# Altium project BLDC-Board-v1.0.PrjPcb (part 6 of 6)
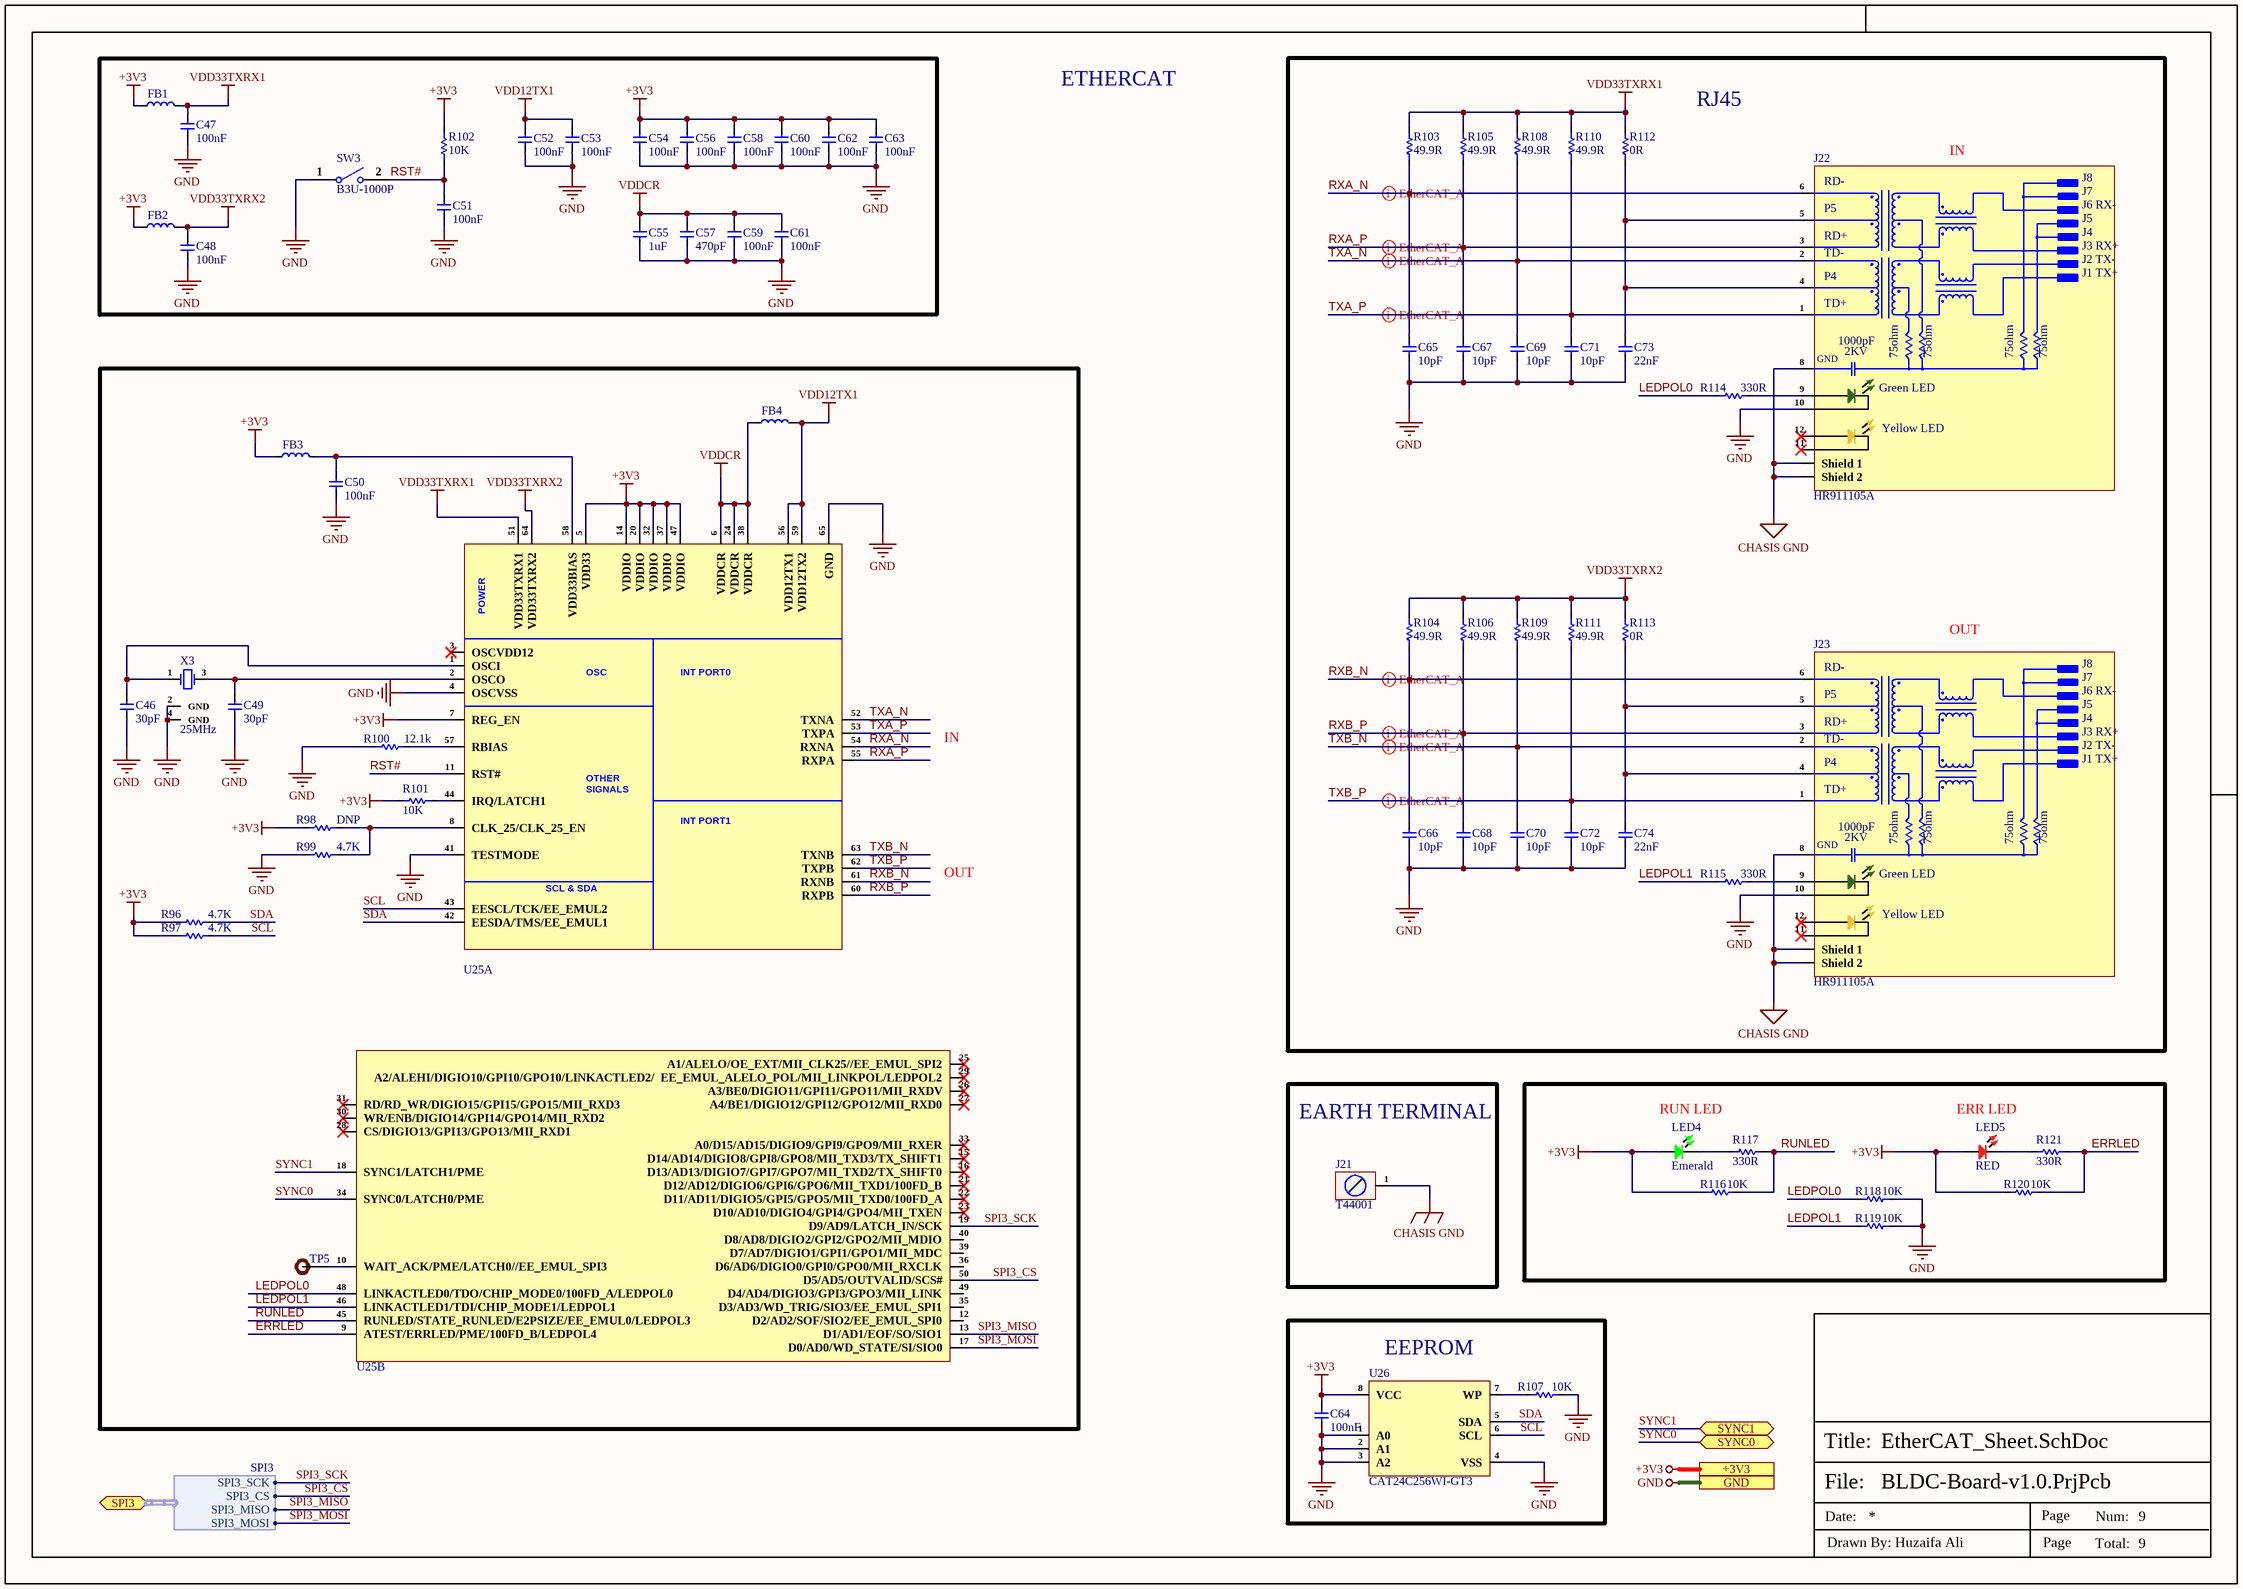
[diagram p9: EtherCAT_Sheet.SchDoc]

## Nets that join several sheets
+3V3: CAN_Sheet (C23.2 C25.2 U5.5 U6.5), Connector_Sheet1 (R78.2 R79.2), Connector_Sheet2 (R88.2 R89.2), Controller_Sheet (18 pins), Motor_Driver_Sheet (8 pins), Power_Sheet (C21.2 R28.1 TP3.1 U4.3), RS485_RS232_Sheet (9 pins), EtherCAT_Sheet (27 pins)
+5V: CAN_Sheet (10 pins), Connector_Sheet1 (8 pins), Connector_Sheet2 (8 pins), Power_Sheet (9 pins)
+24V: Motor_Driver_Sheet (12 pins), Power_Sheet (11 pins)
GND: CAN_Sheet (20 pins), Connector_Sheet1 (14 pins), Connector_Sheet2 (12 pins), Controller_Sheet (43 pins), Motor_Driver_Sheet (24 pins), Power_Sheet (18 pins), RS485_RS232_Sheet (11 pins), EtherCAT_Sheet (46 pins)
ADC_CURRENT1: Controller_Sheet (U1.21), Motor_Driver_Sheet (D21.1 R68.2 U9.4)
ADC_CURRENT2: Controller_Sheet (U1.22), Motor_Driver_Sheet (D22.1 R69.2 U10.4)
ADC_CURRENT3: Controller_Sheet (U1.23), Motor_Driver_Sheet (D23.1 R70.2 U11.4)
ADC_CURRENT4: Controller_Sheet (U1.24), Motor_Driver_Sheet (D24.1 R71.2 U12.4)
CAN1_RX: CAN_Sheet (R33.2), Controller_Sheet (U1.50)
CAN1_TX: CAN_Sheet (R34.2), Controller_Sheet (U1.51)
CAN2_RX: CAN_Sheet (R35.2), Controller_Sheet (U1.15)
CAN2_TX: CAN_Sheet (R36.2), Controller_Sheet (U1.16)
DIR1_IN: Connector_Sheet1 (R76.1), Controller_Sheet (U1.61)
DIR2_IN: Connector_Sheet1 (R77.1), Controller_Sheet (U1.58)
DIR3_IN: Connector_Sheet2 (R86.1), Controller_Sheet (U1.55)
DIR4_IN: Connector_Sheet2 (R87.1), Controller_Sheet (U1.52)
EN_CAN: CAN_Sheet (U5.6), Controller_Sheet (U1.29)
EN_CAN_2: CAN_Sheet (U6.6), Controller_Sheet (U1.37)
FB_1: Connector_Sheet1 (R78.1 U15.4), Controller_Sheet (U1.63)
FB_2: Connector_Sheet1 (R79.1 U16.4), Controller_Sheet (U1.60)
FB_3: Connector_Sheet2 (R88.1 U21.4), Controller_Sheet (U1.57)
FB_4: Connector_Sheet2 (R89.1 U22.4), Controller_Sheet (U1.54)
INH_MASK: CAN_Sheet (U5.11), Controller_Sheet (U1.32)
INH_MASK_2: CAN_Sheet (U6.11), Controller_Sheet (U1.17)
M1_PWR: Controller_Sheet (U2.16), Motor_Driver_Sheet (R72.2)
M2_PWR: Controller_Sheet (U2.17), Motor_Driver_Sheet (R73.2)
M3_PWR: Controller_Sheet (U2.19), Motor_Driver_Sheet (R74.2)
M4_PWR: Controller_Sheet (U2.20), Motor_Driver_Sheet (R75.2)
MOTOR1_GND: Connector_Sheet1 (C40.2 J17.2), Motor_Driver_Sheet (R60.2 U9.1)
MOTOR1_PLUS: Connector_Sheet1 (C40.1 J17.1), Motor_Driver_Sheet (K1.4)
MOTOR2_GND: Connector_Sheet1 (C41.2 J18.2), Motor_Driver_Sheet (R61.2 U10.1)
MOTOR2_PLUS: Connector_Sheet1 (C41.1 J18.1), Motor_Driver_Sheet (K2.4)
MOTOR3_GND: Connector_Sheet2 (C44.2 J19.2), Motor_Driver_Sheet (R62.2 U11.1)
MOTOR3_PLUS: Connector_Sheet2 (C44.1 J19.1), Motor_Driver_Sheet (K3.4)
MOTOR4_GND: Connector_Sheet2 (C45.2 J20.2), Motor_Driver_Sheet (R63.2 U12.1)
MOTOR4_PLUS: Connector_Sheet2 (C45.1 J20.1), Motor_Driver_Sheet (K4.4)
nFAULT_CAN: CAN_Sheet (U5.8), Controller_Sheet (U1.27)
nFAULT_CAN_2: CAN_Sheet (U6.8), Controller_Sheet (U1.3)
nSTB_CAN: CAN_Sheet (U5.14), Controller_Sheet (U1.28)
nSTB_CAN_2: CAN_Sheet (U6.14), Controller_Sheet (U2.14)
PWM1_IN: Connector_Sheet1 (R84.1), Controller_Sheet (U1.62)
PWM2_IN: Connector_Sheet1 (R85.1), Controller_Sheet (U1.59)
PWM3_IN: Connector_Sheet2 (R94.1), Controller_Sheet (U1.56)
PWM4_IN: Connector_Sheet2 (R95.1), Controller_Sheet (U1.53)
RE/DE/RS485/T: Controller_Sheet (U1.18), RS485_RS232_Sheet (R48.1 R49.1 U7.2 U7.3)
RS232_RX: Connector_Sheet1 (J16.1), RS485_RS232_Sheet (F3.1)
RS232_TX: Connector_Sheet1 (J16.2), RS485_RS232_Sheet (F4.1)
RS485_N: Connector_Sheet1 (J15.2), RS485_RS232_Sheet (F1.2)
RS485_P: Connector_Sheet1 (J15.1), RS485_RS232_Sheet (F2.2)
RXD/RS232: Controller_Sheet (U1.31), RS485_RS232_Sheet (R59.2)
RXD/RS485: Controller_Sheet (U1.19), RS485_RS232_Sheet (R46.1)
SPI3_CS: Controller_Sheet (U1.47), EtherCAT_Sheet (U25.50)
SPI3_MISO: Controller_Sheet (U1.1), EtherCAT_Sheet (U25.13)
SPI3_MOSI: Controller_Sheet (U1.2), EtherCAT_Sheet (U25.17)
SPI3_SCK: Controller_Sheet (U1.64), EtherCAT_Sheet (U25.19)
SYNC0: Controller_Sheet (U1.48), EtherCAT_Sheet (U25.34)
SYNC1: Controller_Sheet (U1.49), EtherCAT_Sheet (U25.18)
TXD/RS232: Controller_Sheet (U1.30), RS485_RS232_Sheet (R58.2)
TXD/RS485: Controller_Sheet (U1.20), RS485_RS232_Sheet (R45.1)